# Altium schematic sheet Teensy.SchDoc
size C
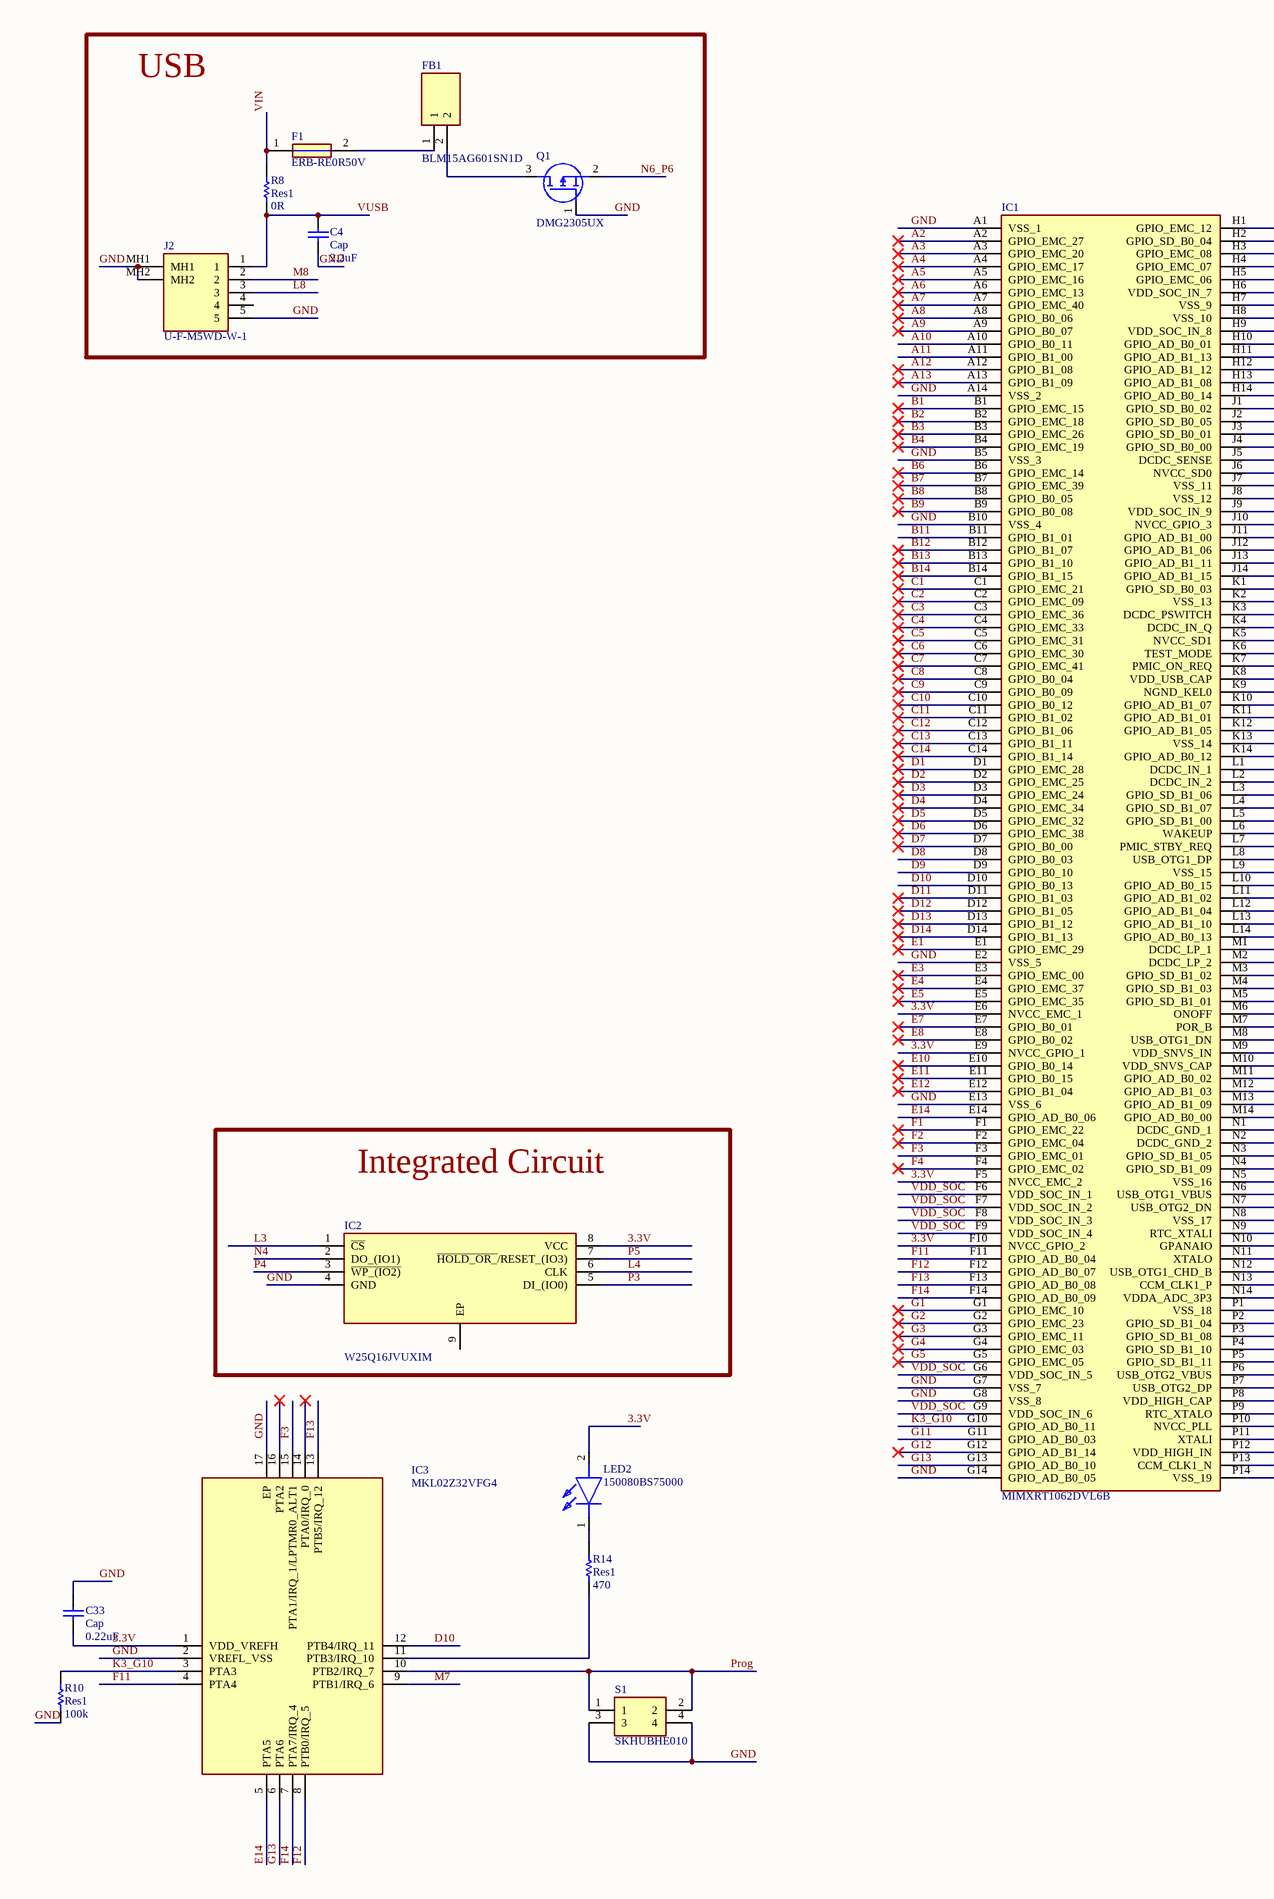
[diagram p0: Teensy.SchDoc, left]
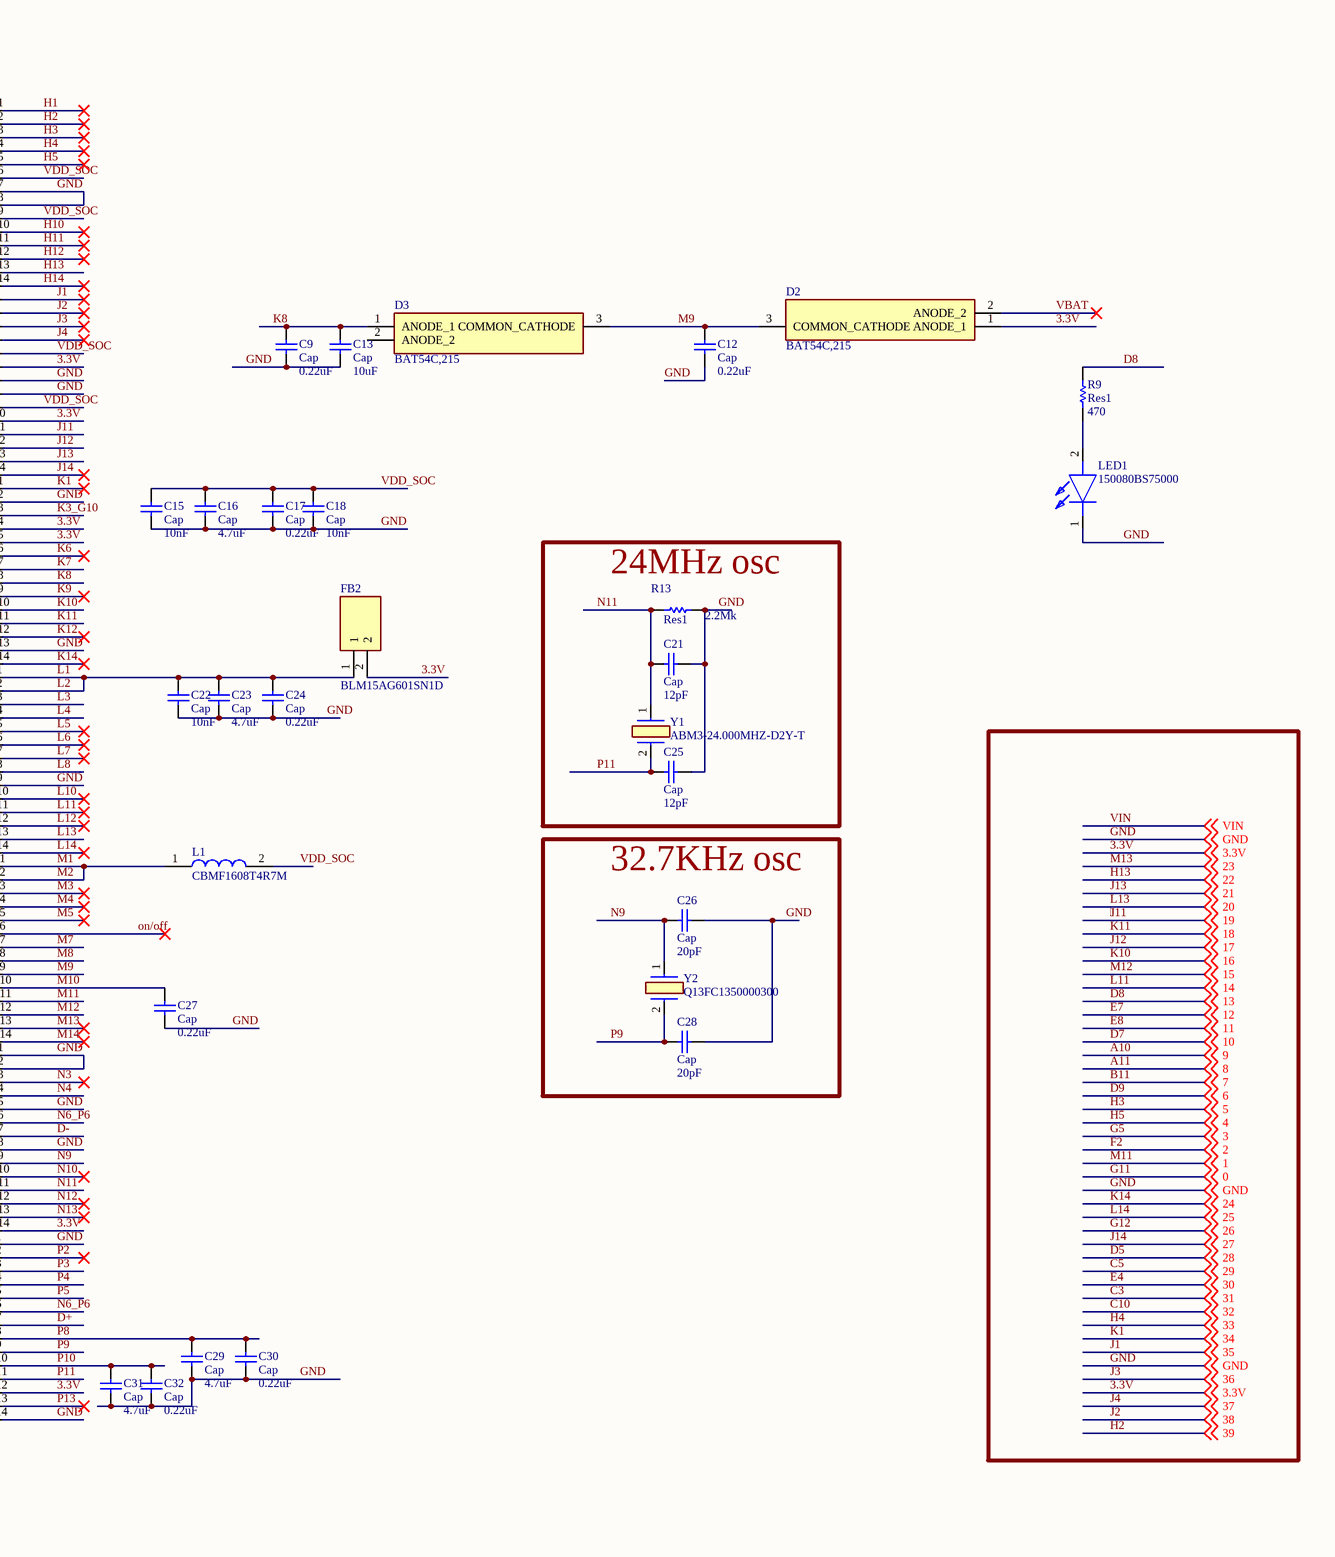
[diagram p1: Teensy.SchDoc, right]

## Parts
C4  Cap  value 2.2uF  [C0402]
C9  Cap  value 0.22uF  [C0402]
C12  Cap  value 0.22uF  [C0402]
C13  Cap  value 10uF  [C0402]
C15  Cap  value 10nF  [C0402]
C16  Cap  value 4.7uF  [C0402]
C17  Cap  value 0.22uF  [C0402]
C18  Cap  value 10nF  [C0402]
C21  Cap  value 12pF  [C0402]
C22  Cap  value 10nF  [C0402]
C23  Cap  value 4.7uF  [C0402]
C24  Cap  value 0.22uF  [C0402]
C25  Cap  value 12pF  [C0402]
C26  Cap  value 20pF  [C0402]
C27  Cap  value 0.22uF  [C0402]
C28  Cap  value 20pF  [C0402]
C29  Cap  value 4.7uF  [C0402]
C30  Cap  value 0.22uF  [C0402]
C31  Cap  value 4.7uF  [C0402]
C32  Cap  value 0.22uF  [C0402]
C33  Cap  value 0.22uF  [C0402]
D2  BAT54C,215  [BAT54C215]
D3  BAT54C,215  [BAT54C215]
F1  ERB-RE0R50V  [ERBRE0R50V]
FB1  BLM15AG601SN1D  [NFZ15SG152SN10B]
FB2  BLM15AG601SN1D  [NFZ15SG152SN10B]
IC1  MIMXRT1062DVL6B  [BGA196C65P14X14_1000X1000X152]
IC2  W25Q16JVUXIM  [SON50P300X200X60-9N]
IC3  MKL02Z32VFG4  [QFN50P300X300X65-17N-D]
J2  U-F-M5WD-W-1  [UFM5WDW1]
L1  CBMF1608T4R7M  [INDC1608X100N]
LED1  150080BS75000  [LEDC2012X80N]
LED2  150080BS75000  [LEDC2012X80N]
Q1  DMG2305UX  [SOT96P240X115-3N]
R8  Res1  value 0R  [R0402]
R9  Res1  value 470  [R0402]
R10  Res1  value 100k  [R0402]
R13  Res1  value 2.2Mk  [R0402]
R14  Res1  value 470  [R0402]
S1  SKHUBHE010  [SKHUBHE010]
Y1  ABM3-24.000MHZ-D2Y-T  [ABM3]
Y2  Q13FC1350000300  [Q13FC1350000300]

## Blocks framed on the sheet
USB: C4 F1 FB1 J2 Q1 R8
24MHz osc: C21 C25 R13 Y1
32.7KHz osc: C26 C28 Y2

## Nets
3.3V: C33.1 D2.1(ANODE_1) FB2.2 IC1.E6(NVCC_EMC_1) IC1.E9(NVCC_GPIO_1) IC1.F5(NVCC_EMC_2) IC1.F10(NVCC_GPIO_2) IC1.J6(NVCC_SD0) IC1.J10(NVCC_GPIO_3) IC1.K4(DCDC_IN_Q) IC1.K5(NVCC_SD1) IC1.N14(VDDA_ADC_3P3) IC1.P12(VDD_HIGH_IN) IC2.8(VCC) IC3.1(VDD_VREFH) LED2.2(A) ; off-sheet 3.3V
: IC1.J11(GPIO_AD_B1_00) ; off-sheet 19  [also labelled 19, J11]
A2: IC1.A2(GPIO_EMC_27)
A3: IC1.A3(GPIO_EMC_20)
A4: IC1.A4(GPIO_EMC_17)
A5: IC1.A5(GPIO_EMC_16)
A6: IC1.A6(GPIO_EMC_13)
A7: IC1.A7(GPIO_EMC_40)
A8: IC1.A8(GPIO_B0_06)
A9: IC1.A9(GPIO_B0_07)
A10: IC1.A10(GPIO_B0_11) ; off-sheet 9  [also labelled 9]
A11: IC1.A11(GPIO_B1_00) ; off-sheet 8  [also labelled 8]
A12: IC1.A12(GPIO_B1_08)
A13: IC1.A13(GPIO_B1_09)
B1: IC1.B1(GPIO_EMC_15)
B2: IC1.B2(GPIO_EMC_18)
B3: IC1.B3(GPIO_EMC_26)
B4: IC1.B4(GPIO_EMC_19)
B6: IC1.B6(GPIO_EMC_14)
B7: IC1.B7(GPIO_EMC_39)
B8: IC1.B8(GPIO_B0_05)
B9: IC1.B9(GPIO_B0_08)
B11: IC1.B11(GPIO_B1_01) ; off-sheet 7  [also labelled 7]
B12: IC1.B12(GPIO_B1_07)
B13: IC1.B13(GPIO_B1_10)
B14: IC1.B14(GPIO_B1_15)
C1: IC1.C1(GPIO_EMC_21)
C2: IC1.C2(GPIO_EMC_09)
C3: IC1.C3(GPIO_EMC_36) ; off-sheet 31  [also labelled 31]
C4: IC1.C4(GPIO_EMC_33)
C5: IC1.C5(GPIO_EMC_31) ; off-sheet 29  [also labelled 29]
C6: IC1.C6(GPIO_EMC_30)
C7: IC1.C7(GPIO_EMC_41)
C8: IC1.C8(GPIO_B0_04)
C9: IC1.C9(GPIO_B0_09)
C10: IC1.C10(GPIO_B0_12) ; off-sheet 32  [also labelled 32]
C11: IC1.C11(GPIO_B1_02)
C12: IC1.C12(GPIO_B1_06)
C13: IC1.C13(GPIO_B1_11)
C14: IC1.C14(GPIO_B1_14)
D1: IC1.D1(GPIO_EMC_28)
D2: IC1.D2(GPIO_EMC_25)
D3: IC1.D3(GPIO_EMC_24)
D4: IC1.D4(GPIO_EMC_34)
D5: IC1.D5(GPIO_EMC_32) ; off-sheet 28  [also labelled 28]
D6: IC1.D6(GPIO_EMC_38)
D7: IC1.D7(GPIO_B0_00) ; off-sheet 10  [also labelled 10]
D8: IC1.D8(GPIO_B0_03) R9.2 ; off-sheet 13  [also labelled 13]
D9: IC1.D9(GPIO_B0_10) ; off-sheet 6  [also labelled 6]
D10: IC1.D10(GPIO_B0_13) IC3.12(PTB4/IRQ_11)
D11: IC1.D11(GPIO_B1_03)
D12: IC1.D12(GPIO_B1_05)
D13: IC1.D13(GPIO_B1_12)
D14: IC1.D14(GPIO_B1_13)
D+: IC1.P7(USB_OTG2_DP)
D-: IC1.N7(USB_OTG2_DN)
E1: IC1.E1(GPIO_EMC_29)
E3: IC1.E3(GPIO_EMC_00)
E4: IC1.E4(GPIO_EMC_37) ; off-sheet 30  [also labelled 30]
E5: IC1.E5(GPIO_EMC_35)
E7: IC1.E7(GPIO_B0_01) ; off-sheet 12  [also labelled 12]
E8: IC1.E8(GPIO_B0_02) ; off-sheet 11  [also labelled 11]
E10: IC1.E10(GPIO_B0_14)
E11: IC1.E11(GPIO_B0_15)
E12: IC1.E12(GPIO_B1_04)
E14: IC1.E14(GPIO_AD_B0_06) IC3.5(PTA5)
F1: IC1.F1(GPIO_EMC_22)
F2: IC1.F2(GPIO_EMC_04) ; off-sheet 2  [also labelled 2]
F3: IC1.F3(GPIO_EMC_01) IC3.15(PTA1/IRQ_1/LPTMR0_ALT1)
F4: IC1.F4(GPIO_EMC_02)
F11: IC1.F11(GPIO_AD_B0_04) IC3.4(PTA4)
F12: IC1.F12(GPIO_AD_B0_07) IC3.8(PTB0/IRQ_5)
F13: IC1.F13(GPIO_AD_B0_08) IC3.13(PTB5/IRQ_12)
F14: IC1.F14(GPIO_AD_B0_09) IC3.7(PTA7/IRQ_4)
G1: IC1.G1(GPIO_EMC_10)
G2: IC1.G2(GPIO_EMC_23)
G3: IC1.G3(GPIO_EMC_11)
G4: IC1.G4(GPIO_EMC_03)
G5: IC1.G5(GPIO_EMC_05) ; off-sheet 3  [also labelled 3]
G11: IC1.G11(GPIO_AD_B0_03) ; off-sheet 0  [also labelled 0]
G12: IC1.G12(GPIO_AD_B1_14) ; off-sheet 26  [also labelled 26]
G13: IC1.G13(GPIO_AD_B0_10) IC3.6(PTA6)
GND: C4.1 C9.1 C12.1 C13.1 C15.1 C16.1 C17.1 C18.1 C21.1 C22.1 C23.1 C24.1 C25.1 C26.1 C27.1 C28.1 C29.1 C30.1 C31.1 C32.1 C33.2 IC1.A1(VSS_1) IC1.A14(VSS_2) IC1.B5(VSS_3) IC1.B10(VSS_4) IC1.E2(VSS_5) IC1.E13(VSS_6) IC1.G7(VSS_7) IC1.G8(VSS_8) IC1.G14(GPIO_AD_B0_05) IC1.H7(VSS_9) IC1.H8(VSS_10) IC1.J7(VSS_11) IC1.J8(VSS_12) IC1.K2(VSS_13) IC1.K13(VSS_14) IC1.L9(VSS_15) IC1.N1(DCDC_GND_1) IC1.N2(DCDC_GND_2) IC1.N5(VSS_16) IC1.N8(VSS_17) IC1.P1(VSS_18) IC1.P14(VSS_19) IC2.4(GND) IC3.2(VREFL_VSS) IC3.17(EP) J2.5 J2.MH1 J2.MH2 LED1.1(K) Q1.1(G) R10.1 R13.1 S1.3 S1.4 ; off-sheet GND
H1: IC1.H1(GPIO_EMC_12)
H2: IC1.H2(GPIO_SD_B0_04) ; off-sheet 39  [also labelled 39]
H3: IC1.H3(GPIO_EMC_08) ; off-sheet 5  [also labelled 5]
H4: IC1.H4(GPIO_EMC_07) ; off-sheet 33  [also labelled 33]
H5: IC1.H5(GPIO_EMC_06) ; off-sheet 4  [also labelled 4]
H10: IC1.H10(GPIO_AD_B0_01)
H11: IC1.H11(GPIO_AD_B1_13)
H12: IC1.H12(GPIO_AD_B1_12)
H13: IC1.H13(GPIO_AD_B1_08) ; off-sheet 22  [also labelled 22]
H14: IC1.H14(GPIO_AD_B0_14)
J1: IC1.J1(GPIO_SD_B0_02) ; off-sheet 35  [also labelled 35]
J2: IC1.J2(GPIO_SD_B0_05) ; off-sheet 38  [also labelled 38]
J3: IC1.J3(GPIO_SD_B0_01) ; off-sheet 36  [also labelled 36]
J4: IC1.J4(GPIO_SD_B0_00) ; off-sheet 37  [also labelled 37]
J12: IC1.J12(GPIO_AD_B1_06) ; off-sheet 17  [also labelled 17]
J13: IC1.J13(GPIO_AD_B1_11) ; off-sheet 21  [also labelled 21]
J14: IC1.J14(GPIO_AD_B1_15) ; off-sheet 27  [also labelled 27]
K1: IC1.K1(GPIO_SD_B0_03) ; off-sheet 34  [also labelled 34]
K3_G10: IC1.G10(GPIO_AD_B0_11) IC1.K3(DCDC_PSWITCH) IC3.3(PTA3) R10.2
K6: IC1.K6(TEST_MODE)
K7: IC1.K7(PMIC_ON_REQ)
K8: C9.2 C13.2 D3.1(ANODE_1) IC1.K8(VDD_USB_CAP)
K9: IC1.K9(NGND_KEL0)
K10: IC1.K10(GPIO_AD_B1_07) ; off-sheet 16  [also labelled 16]
K11: IC1.K11(GPIO_AD_B1_01) ; off-sheet 18  [also labelled 18]
K12: IC1.K12(GPIO_AD_B1_05)
K14: IC1.K14(GPIO_AD_B0_12) ; off-sheet 24  [also labelled 24]
L1: C22.2 C23.2 C24.2 FB2.1 IC1.L1(DCDC_IN_1) IC1.L2(DCDC_IN_2)  [also labelled L2]
L3: IC1.L3(GPIO_SD_B1_06) IC2.1(~{CS})
L4: IC1.L4(GPIO_SD_B1_07) IC2.6(CLK)
L5: IC1.L5(GPIO_SD_B1_00)
L6: IC1.L6(WAKEUP)
L7: IC1.L7(PMIC_STBY_REQ)
L8: IC1.L8(USB_OTG1_DP) J2.3
L10: IC1.L10(GPIO_AD_B0_15)
L11: IC1.L11(GPIO_AD_B1_02) ; off-sheet 14  [also labelled 14]
L12: IC1.L12(GPIO_AD_B1_04)
L13: IC1.L13(GPIO_AD_B1_10) ; off-sheet 20  [also labelled 20]
L14: IC1.L14(GPIO_AD_B0_13) ; off-sheet 25  [also labelled 25]
M1: IC1.M1(DCDC_LP_1) IC1.M2(DCDC_LP_2) L1.1  [also labelled M2]
M3: IC1.M3(GPIO_SD_B1_02)
M4: IC1.M4(GPIO_SD_B1_03)
M5: IC1.M5(GPIO_SD_B1_01)
M7: IC1.M7(POR_B) IC3.9(PTB1/IRQ_6)
M8: IC1.M8(USB_OTG1_DN) J2.2
M9: C12.2 D2.3(COMMON_CATHODE) D3.3(COMMON_CATHODE) IC1.M9(VDD_SNVS_IN)
M10: C27.2 IC1.M10(VDD_SNVS_CAP)
M11: IC1.M11(GPIO_AD_B0_02) ; off-sheet 1  [also labelled 1]
M12: IC1.M12(GPIO_AD_B1_03) ; off-sheet 15  [also labelled 15]
M13: IC1.M13(GPIO_AD_B1_09) ; off-sheet 23  [also labelled 23]
M14: IC1.M14(GPIO_AD_B0_00)
N3: IC1.N3(GPIO_SD_B1_05)
N4: IC1.N4(GPIO_SD_B1_09) IC2.2(DO_(IO1))
N6_P6: IC1.N6(USB_OTG1_VBUS) IC1.P6(USB_OTG2_VBUS) Q1.2(S)
N9: C26.2 IC1.N9(RTC_XTALI) Y2.1
N10: IC1.N10(GPANAIO)
N11: C21.2 IC1.N11(XTALO) R13.2 Y1.1
N12: IC1.N12(USB_OTG1_CHD_B)
N13: IC1.N13(CCM_CLK1_P)
on/off: IC1.M6(ONOFF)
P2: IC1.P2(GPIO_SD_B1_04)
P3: IC1.P3(GPIO_SD_B1_08) IC2.5(DI_(IO0))
P4: IC1.P4(GPIO_SD_B1_10) IC2.3(~{WP_(IO2)})
P5: IC1.P5(GPIO_SD_B1_11) IC2.7(~{HOLD_OR_}/RESET_(IO3))
P8: C29.2 C30.2 IC1.P8(VDD_HIGH_CAP)
P9: C28.2 IC1.P9(RTC_XTALO) Y2.2(CRYSTAL_2)
P10: C31.2 C32.2 IC1.P10(NVCC_PLL)
P11: C25.2 IC1.P11(XTALI) Y1.2
P13: IC1.P13(CCM_CLK1_N)
Prog: IC3.10(PTB2/IRQ_7) S1.1 S1.2
VBAT: D2.2(ANODE_2)
VDD_SOC: C15.2 C16.2 C17.2 C18.2 IC1.F6(VDD_SOC_IN_1) IC1.F7(VDD_SOC_IN_2) IC1.F8(VDD_SOC_IN_3) IC1.F9(VDD_SOC_IN_4) IC1.G6(VDD_SOC_IN_5) IC1.G9(VDD_SOC_IN_6) IC1.H6(VDD_SOC_IN_7) IC1.H9(VDD_SOC_IN_8) IC1.J5(DCDC_SENSE) IC1.J9(VDD_SOC_IN_9) L1.2
VIN: F1.1 R8.2 ; off-sheet VIN
VUSB: C4.2 J2.1 R8.1
NetF1_2: F1.2 FB1.1
NetFB1_2: FB1.2 Q1.3(D)
NetIC3_11: IC3.11(PTB3/IRQ_10) R14.1
NetLED1_2: LED1.2(A) R9.1
NetLED2_1: LED2.1(K) R14.2

Not connected (* = marked no-connect by the designer): D3 2(ANODE_2); IC2 9(EP); IC3 14(PTA0/IRQ_0)* 16(PTA2)*; J2 4

## Notes on the sheet
- Integrated Circuit

## Library data of the parts
C4 C9 C12 C13 C15-C18 C21-C33 = Cap: Capacitor; Published: 8-Jun-2000; LatestRevisionDate: 17-Jul-2002; LatestRevisionNote: Re-released for DXP Platform.; PackageReference: RAD-0.3; Publisher: Altium Limited; PackageDescription: Radial Cap, Thru-Hole; 2 Leads; 0.3 in Pin Spacing
  C4: JLC part: C521077
  C9 C12 C17 C24 C27 C30 C32 C33: JLC part: C123456
  C13: JLC part: C5119308
  C15 C18 C22: JLC part: C482489
  C16 C23 C29 C31: JLC part: C274416
  C21 C25: JLC part: C482487
  C26 C28: JLC part: C469636
D2 D3 = BAT54C,215: Schottky Diode; Manufacturer_Name: Nexperia; Datasheet Link: https://assets.nexperia.com/documents/data-sheet/BAT54_SER.pdf; Height: 1.1mm; Manufacturer_Part_Number: BAT54C,215; Mouser Part Number: 771-BAT54C-T/R; Mouser Price/Stock: https://www.mouser.co.uk/ProductDetail/Nexperia/BAT54C215?qs=me8TqzrmIYV5SKKt13YKQA%3D%3D; Arrow Part Number: BAT54C,215; Arrow Price/Stock: https://www.arrow.com/en/products/bat54c215/nexperia?region=europe; JLC part: C37704
F1 = ERB-RE0R50V: Fuse; Manufacturer_Name: Panasonic; Datasheet Link: https://industrial.panasonic.com/cdbs/www-data/pdf/AFA0000/AFA0000C7.pdf; Height: 0.64mm; Manufacturer_Part_Number: ERB-RE0R50V; Mouser Part Number: 667-ERB-RE0R50V; Mouser Price/Stock: https://www.mouser.co.uk/ProductDetail/Panasonic/ERB-RE0R50V?qs=YIEcsSB2Lz7PmNMITqV3lw%3D%3D; Arrow Part Number: ERB-RE0R50V; Arrow Price/Stock: https://www.arrow.com/en/products/erb-re0r50v/panasonic?region=nac; JLC part: C713404
FB1 FB2 = BLM15AG601SN1D: Ferrite Bead; Manufacturer_Name: Murata Electronics; Datasheet Link: http://www.murata.com/~/media/webrenewal/support/library/catalog/products/emc/emifil/c31e.ashx?la=en-gb; Height: 0.55mm; Manufacturer_Part_Number: BLM15AG601SN1D; Mouser Part Number: 81-BLM15AG601SN1D; Mouser Price/Stock: https://www.mouser.co.uk/ProductDetail/Murata-Electronics/BLM15AG601SN1D?qs=%2FjCH2pcB5WLSIF5DG9Nbqw%3D%3D; Arrow Part Number: BLM15AG601SN1D; Arrow Price/Stock: https://www.arrow.com/en/products/blm15ag601sn1d/murata-manufacturing?region=nac; JLC part: C76884
  FB1: ComponentLink1Description: New link; ComponentLink1URL: *
IC1 = MIMXRT1062DVL6B: Integrated Circuit; Manufacturer_Name: NXP; Datasheet Link: https://www.nxp.com/docs/en/nxp/data-sheets/IMXRT1060CEC.pdf; Height: 1.52mm; Manufacturer_Part_Number: MIMXRT1062DVL6B; Mouser Part Number: 771-MIMXRT1062DVL6B; Mouser Price/Stock: https://www.mouser.co.uk/ProductDetail/NXP-Semiconductors/MIMXRT1062DVL6B?qs=BJlw7L4Cy79qwRIf5%2FpmLg%3D%3D; Arrow Part Number: MIMXRT1062DVL6B; Arrow Price/Stock: https://www.arrow.com/en/products/mimxrt1062dvl6b/nxp-semiconductors?region=nac; JLC part: C2847497
IC2 = W25Q16JVUXIM: Integrated Circuit; Manufacturer_Name: Winbond; Datasheet Link: https://www.winbond.com/hq/search-resource-file.jsp?partNo=W25Q16JVUXIM&type=datasheet; Height: 0.6mm; Manufacturer_Part_Number: W25Q16JVUXIM; JLC part: C6025198
IC3 = MKL02Z32VFG4: Integrated Circuit; Manufacturer_Name: NXP; Datasheet Link: http://www.nxp.com/docs/en/data-sheet/KL02P32M48SF0.pdf; Height: 0.65mm; Manufacturer_Part_Number: MKL02Z32VFG4; Mouser Part Number: 841-MKL02Z32VFG4; Mouser Price/Stock: https://www.mouser.co.uk/ProductDetail/NXP-Semiconductors/MKL02Z32VFG4?qs=RECgZY%252BK1xLpPFD7GzHxWg%3D%3D; Arrow Part Number: MKL02Z32VFG4; Arrow Price/Stock: https://www.arrow.com/en/products/mkl02z32vfg4/nxp-semiconductors?region=nac; JLC part: C1337508
J2 = U-F-M5WD-W-1: Connector; Manufacturer_Name: Korean Hroparts Elec; Datasheet Link: https://datasheet.lcsc.com/szlcsc/1903211731_Korean-Hroparts-Elec-U-F-M5WD-W-1_C145779.pdf; Height: 2.4mm; Manufacturer_Part_Number: U-F-M5WD-W-1; JLC part: C145779
L1 = CBMF1608T4R7M: Inductor; Manufacturer_Name: TAIYO YUDEN; Datasheet Link: https://componentsearchengine.com/Datasheets/2/CBMF1608T4R7M.pdf; Height: 1mm; Manufacturer_Part_Number: CBMF1608T4R7M; Mouser Part Number: 963-CBMF1608T4R7M; Mouser Price/Stock: https://www.mouser.co.uk/ProductDetail/Taiyo-Yuden/CBMF1608T4R7M?qs=I6KAKw0tg2xEc27SWlc69A%3D%3D; Arrow Part Number: CBMF1608T4R7M; Arrow Price/Stock: https://www.arrow.com/en/products/cbmf1608t4r7m/taiyo-yuden?region=nac; JLC part: C92984
LED1 LED2 = 150080BS75000: LED; Manufacturer_Name: Wurth Elektronik; Datasheet Link: https://katalog.we-online.com/led/datasheet/150080BS75000.pdf; Height: 0.8mm; Manufacturer_Part_Number: 150080BS75000; Mouser Part Number: 710-150080BS75000; Mouser Price/Stock: https://www.mouser.co.uk/ProductDetail/Wurth-Elektronik/150080BS75000?qs=2kOmHSv6VfT2tBo3UPVqAQ%3D%3D; JLC part: C6067133
Q1 = DMG2305UX: MOSFET (P-Channel); Manufacturer_Name: Diodes Incorporated; Datasheet Link: https://www.diodes.com/assets/Datasheets/DMG2305UX.pdf; Height: 1.15mm; Manufacturer_Part_Number: DMG2305UX; Mouser Part Number: N/A; Mouser Price/Stock: https://www.mouser.co.uk/ProductDetail/Diodes-Incorporated/DMG2305UX?qs=Wj%2FVkw3K%252BMAET%252BYv6pXgHQ%3D%3D; JLC part: C2940629
R8-R10 R13 R14 = Res1: Resistor; Published: 8-Jun-2000; LatestRevisionDate: 17-Jul-2002; LatestRevisionNote: Re-released for DXP Platform.; PackageReference: AXIAL-0.3; Publisher: Altium Limited; PackageDescription: Axial Device, Thru-Hole; 2 Leads; 0.3 in Pin Spacing
  R8: JLC part: C279984
  R9 R14: JLC part: C881342
  R10: JLC part: C705662
  R13: JLC part: C170262
S1 = SKHUBHE010: Switch; Manufacturer_Name: ALPS Electric; Datasheet Link: https://componentsearchengine.com/Datasheets/1/SKHUBHE010.pdf; Height: 3.1mm; Manufacturer_Part_Number: SKHUBHE010; Mouser Part Number: 688-SKHUBHE010; Mouser Price/Stock: https://www.mouser.com/Search/Refine.aspx?Keyword=688-SKHUBHE010; JLC part: C139768
Y1 = ABM3-24.000MHZ-D2Y-T: Crystal or Oscillator; Manufacturer_Name: ABRACON; Datasheet Link: https://abracon.com/Resonators/abm3.pdf; Height: 1.3mm; Manufacturer_Part_Number: ABM3-24.000MHZ-D2Y-T; Mouser Part Number: 815-ABM3-24-D2Y-T; Mouser Price/Stock: https://www.mouser.co.uk/ProductDetail/ABRACON/ABM3-24.000MHZ-D2Y-T?qs=ihRgKfnEsN7QIYosfWUeVg%3D%3D; Arrow Part Number: ABM3-24.000MHZ-D2Y-T; Arrow Price/Stock: https://www.arrow.com/en/products/abm3-24.000mhz-d2y-t/abracon?region=nac; JLC part: C1985382
Y2 = Q13FC1350000300: Crystal or Oscillator; Manufacturer_Name: Seiko Epson Corporation; Datasheet Link: https://datasheet.lcsc.com/lcsc/1810181110_Seiko-Epson-Q13FC1350000300_C99010.pdf; Height: 0.9mm; Manufacturer_Part_Number: Q13FC1350000300; JLC part: C1669858